# Altium schematic sheet Opamp_Sheet-v4.0.3.SchDoc
size 420 x 297 mm; SheetNumber: 1; SheetTotal: 1
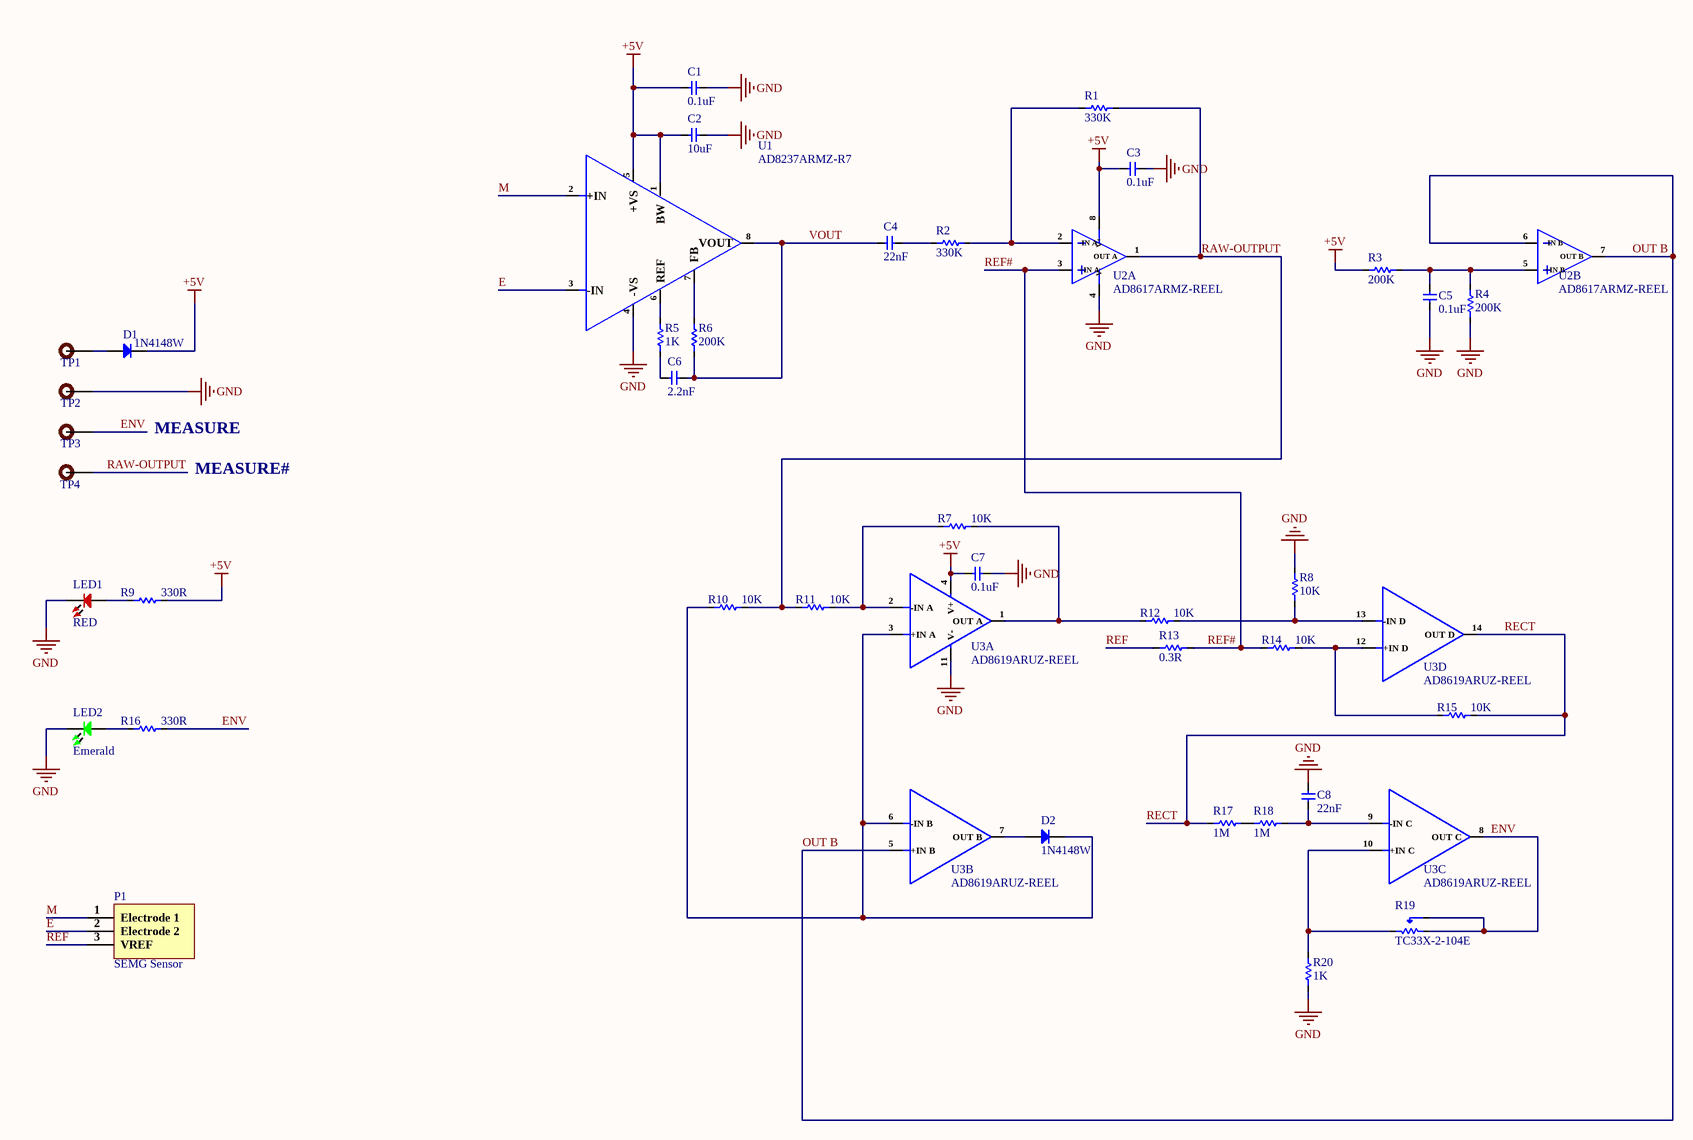
[diagram p0: Opamp_Sheet-v4.0.3.SchDoc]

## Parts
C1  0.1uF  [Cap-0402]
C2  10uF  [Cap-0603]
C3  0.1uF  [Cap-0402]
C4  22nF  [Cap-0402]
C5  0.1uF  [Cap-0402]
C6  2.2nF  [Cap-0402]
C7  0.1uF  [Cap-0402]
C8  22nF  [Cap-0402]
D1  1N4148W  [SOD-123]
D2  1N4148W  [SOD-123]
LED1  RED  [LED-0603]
LED2  Emerald  [LED-0603]
P1  SEMG Sensor  [sEMG-sensor]
R1  330K  [Res-0402]
R2  330K  [Res-0402]
R3  200K  [Res-0402]
R4  200K  [Res-0402]
R5  1K  [Res-0402]
R6  200K  [Res-0402]
R7  10K  [Res-0402]
R8  10K  [Res-0402]
R9  330R  [Res-0402]
R10  10K  [Res-0402]
R11  10K  [Res-0402]
R12  10K  [Res-0402]
R13  0.3R  [Res-0603]
R14  10K  [Res-0402]
R15  10K  [Res-0402]
R16  330R  [Res-0402]
R17  1M  [Res-0402]
R18  1M  [Res-0402]
R19  TC33X-2-104E  [TC33X-2-104E_]
R20  1K  [Res-0402]
TP1  TEST POINT  [Test-point]  (value not drawn)  (no BOM)
TP2  TEST POINT  [Test-point]  (value not drawn)  (no BOM)
TP3  TEST POINT  [Test-point]  (value not drawn)  (no BOM)
TP4  TEST POINT  [Test-point]  (value not drawn)  (no BOM)
U1  AD8237ARMZ-R7  [MSOP-8]
U2  AD8617ARMZ-REEL  [MSOP-8]  (parts A,B of 2)
U3  AD8619ARUZ-REEL  [14-TSSOP]  (parts A,B,C,D of 4)

## Nets
+5V: C1.1 C2.1 C3.1 C7.1 D1.2(K) R3.2 R9.1 U1.1(BW) U1.5(+VS) U2.8(V+) U3.4(V+)
GND: C1.2 C2.2 C3.2 C5.1 C7.2 C8.2 LED1.2 LED2.2 R4.1 R8.2 R20.1 TP2.1 U1.4(-VS) U2.4(V-) U3.11(V-)
E: P1.2(Electrode_2) U1.3(-IN)
ENV: R16.1 R19.1(CCW) R19.2(Wiper) TP3.1 U3.8(OUT_C)
M: P1.1(Electrode_1) U1.2(+IN)
OUT B: U2.6(-IN_B) U2.7(OUT_B) U3.5(+IN_B)
RAW-OUTPUT: R1.2 R10.2 R11.1 TP4.1 U2.1(OUT_A)
RECT: R15.2 R17.1 U3.14(OUT_D)
REF: P1.3(VREF) R13.1
REF#: R13.2 R14.1 U2.3(+IN_A)
VOUT: C4.1 C6.1 R6.2 U1.8(VOUT)
NetC4_2: C4.2 R2.1
NetC5_2: C5.2 R3.1 R4.2 U2.5(+IN_B)
NetC6_2: C6.2 R5.2
NetC8_1: C8.1 R18.2 U3.9(-IN_C)
NetD1_1: D1.1(A) TP1.1
NetD2_1: D2.1(A) U3.7(OUT_B)
NetD2_2: D2.2(K) R10.1 U3.3(+IN_A) U3.6(-IN_B)
NetLED1_1: LED1.1 R9.2
NetLED2_1: LED2.1 R16.2
NetR1_1: R1.1 R2.2 U2.2(-IN_A)
NetR5_1: R5.1 U1.6(REF)
NetR6_1: R6.1 U1.7(FB)
NetR7_1: R7.1 R11.2 U3.2(-IN_A)
NetR7_2: R7.2 R12.1 U3.1(OUT_A)
NetR8_1: R8.1 R12.2 U3.13(-IN_D)
NetR14_2: R14.2 R15.1 U3.12(+IN_D)
NetR17_2: R17.2 R18.1
NetR19_3: R19.3(CW) R20.2 U3.10(+IN_C)

## Notes on the sheet
- MEASURE
- MEASURE#
- File:
- Title:
- Date:
- Page
- Num:
- Total:
- Drawn By: Huzaifa Ali

## Library data of the parts
C1 C3 C5 C7 = C1005X5R1H104K050BB: CAP CER 0.1UF 50V X5R 0402; Manufacturer: TDK; Dielectric Material: Ceramic; Capacitance: 100nF; Tolerance: 10%; Item Type: Capacitor; Supplier 1: Digi-Key; Manufacturer Part Number: C1005X5R1H104K050BB; Stock 1: 1455182; Pricing 1: 1=0.12, 10=0.09, 50=0.049, 100=0.04, 500=0.02858, 1000=0.02245, 2500=0.02041, 5000=0.01878 (USD); Mount: Surface Mount; Case/Package: 0402; Case Code (Metric): 1005; Case Code (Imperial): 0402; Weight: 2.3E-05oz; Min Operating Temperature: -55°C; Max Operating Temperature: 85°C; Dielectric: X5R; Voltage Rating: 50V; Packaging: Tape and Reel; Voltage Rating (DC): 50V; Termination: SMD/SMT; Construction: Flat; Package Quantity: 1; Resistor Type: Ceramic; Voltage: 50V; Series: C; Length: 1mm; Width: 0.02inch; Height: 0.5mm; Depth: 0.5mm; Thickness: 0.022inch; Radiation Hardening: No; Lead Free: Lead Free; REACH SVHC: No SVHC; RoHS Compliant: Yes; ComponentLink1URL: https://product.tdk.com/info/en/catalog/spec/mlccspec_commercial_general_midvoltage_en.pdf?src-supplier=Digi-Key; ComponentLink1Description: https://product.tdk.com/info/en/catalog/spec/mlccspec_commercial_general_midvoltage_en.pdf?src-supplier=Digi-Key; ComponentLink2URL: http://www.tdk.co.jp/tefe02/e413_c.pdf?src-supplier=Future+Electronics; ComponentLink2Description: http://www.tdk.co.jp/tefe02/e413_c.pdf?src-supplier=Future+Electronics; ComponentLink3URL: https://www.verical.com/server-webapp/html/getDatasheet?partID=743571&src-supplier=Verical; ComponentLink3Description: https://www.verical.com/server-webapp/html/getDatasheet?partID=743571&src-supplier=Verical; ComponentLink4URL: http://www.tdk.co.jp/tefe02/e412_c.pdf?src-supplier=Avnet+Europe; ComponentLink4Description: http://www.tdk.co.jp/tefe02/e412_c.pdf?src-supplier=Avnet+Europe; Supplier Part Number 1: 445-5942-1-ND; LCSC Part Number: C2181865
C2 = GRM188R6YA106MA73D: 10uF 35V X5R 20% Pad SMD 0603; Manufacturer: Murata; Supplier 1: Arrow Electronics; Manufacturer Part Number: GRM188R6YA106MA73D; RoHS: Yes; Category: Ceramic Capacitors; Stock 1: 37601; Pricing 1: 1=0.36650, 10=0.23380, 25=0.23160, 100=0.15050, 250=0.14890, 500=0.10700, 1000=0.09270, 3000=0.08640, 6000=0.07720, 15000=0.07140, 30000=0.05840 (USD); Mount: Surface Mount; Case/Package: 0603; Case Code (Metric): 1608; Case Code (Imperial): 0603; Min Operating Temperature: -55°C; Max Operating Temperature: 85°C; Packaging: Tape and Reel; Capacitance: 10uF; Voltage Rating: 35V; Tolerance: 20%; Voltage Rating (DC): 35V; Dielectric: X5R; Length: 0.063inch; Width: 0.031inch; Thickness: 0.039inch; RoHS Compliant: Yes; ComponentLink1URL: http://search.murata.co.jp/Ceramy/image/img/A01X/G101/ENG/GRM188R6YA106MA73-01.pdf?src-supplier=Future+Electronics; ComponentLink1Description: http://search.murata.co.jp/Ceramy/image/img/A01X/G101/ENG/GRM188R6YA106MA73-01.pdf?src-supplier=Future+Electronics; ComponentLink2URL: http://search.murata.co.jp/Ceramy/image/img/A01X/G101/ENG/GRM188R6YA106MA73-01.pdf?src-supplier=Digi-Key; ComponentLink2Description: http://search.murata.co.jp/Ceramy/image/img/A01X/G101/ENG/GRM188R6YA106MA73-01.pdf?src-supplier=Digi-Key; ComponentLink3URL: https://www.murata.com/~/media/webrenewal/support/library/catalog/products/capacitor/mlcc/c02e.ashx?la=en-us&src-supplier=Digi-Key; ComponentLink3Description: https://www.murata.com/~/media/webrenewal/support/library/catalog/products/capacitor/mlcc/c02e.ashx?la=en-us&src-supplier=Digi-Key; ComponentLink4URL: http://search.murata.co.jp/Ceramy/image/img/A01X/G101/ENG/GRM188R6YA106MA73-01.pdf?src-supplier=Mouser; ComponentLink4Description: http://search.murata.co.jp/Ceramy/image/img/A01X/G101/ENG/GRM188R6YA106MA73-01.pdf?src-supplier=Mouser; ComponentLink5URL: http://search.murata.co.jp/Ceramy/image/img/A01X/G101/ENG/GRM188R6YA106MA73-01.pdf?src-supplier=TTI; ComponentLink5Description: http://search.murata.co.jp/Ceramy/image/img/A01X/G101/ENG/GRM188R6YA106MA73-01.pdf?src-supplier=TTI; Supplier Part Number 1: GRM188R6YA106MA73D; LCSC Part Number: C194427
C4 = CC0402KRX5R7BB223: CAP CER 0.022UF 16V X5R 0402; Manufacturer: Yageo; Tolerance: 10%; Supplier 1: Mouser; Manufacturer Part Number: CC0402KRX5R7BB223; RoHS: Yes; Category: Ceramic Capacitors; Stock 1: 31160; Pricing 1: 1=0.10000, 10=0.05600, 50=0.05600, 100=0.02500, 1000=0.01400, 10000=0.01000 (USD); Mount: Surface Mount; Case/Package: 0402; Case Code (Metric): 1005; Case Code (Imperial): 0402; Min Operating Temperature: -55°C; Max Operating Temperature: 85°C; Packaging: Tape and Reel; Capacitance: 22nF; Voltage Rating: 16V; Voltage Rating (DC): 16V; Dielectric: X5R; Length: 0.039inch; Width: 0.02inch; Thickness: 0.022inch; Lead Free: Lead Free; Halogen Free: Halogen Free; RoHS Compliant: Yes; ComponentLink1URL: http://www.yageo.com/exep/pages/download/literatures/ProductSelectionGuide%202014_Final_2.pdf?src-supplier=Digi-Key; ComponentLink1Description: http://www.yageo.com/exep/pages/download/literatures/ProductSelectionGuide%202014_Final_2.pdf?src-supplier=Digi-Key; ComponentLink2URL: http://www.yageo.com/documents/recent/UPY-GPHC_X5R_4V-to-50V_25.pdf?src-supplier=Digi-Key; ComponentLink2Description: http://www.yageo.com/documents/recent/UPY-GPHC_X5R_4V-to-50V_25.pdf?src-supplier=Digi-Key; Supplier Part Number 1: 603-CC402KRX5R7BB223; LCSC Part Number: C541399
C6 = 04025C222JAT2A: CAP CER 2.2nF 50V X7R ±5% 0402 MLCC - SMD/SMT ROHS; Manufacturer: Kyocera AVX; Item Type: Capacitor; Manufacturer Part Number: 04025C222JAT2A; Package: 0402; LCSC Part Number: C597041; ComponentLink1Description: LCSC; ComponentLink1URL: https://www.lcsc.com/product-detail/Multilayer-Ceramic-Capacitors-MLCC-SMD-SMT_Kyocera-AVX-04025C222JAT2A_C597041.html
C8 = CC0402JRX7R7BB223: CAP CER 0.022UF 16V X7R 0402; Manufacturer: Yageo; Tolerance: 5%; Item Type: Capacitor; Supplier: Digikey; Supplier Part Number: 311-3758-1-ND; Manufacturer Part Number: CC0402JRX7R7BB223; RoHS: Yes; Category: Ceramic Capacitors; Stock: 4203; Pricing: 1=0.1, 10=0.033, 50=0.0192, 100=0.0149, 500=0.0112, 1000=0.0088, 2500=0.008, 5000=0.00736 (USD); Mounting Technology: Surface Mount; Case/Package: 0402; Case Code (Imperial): 0402; Case Code (Metric): 1005; Weight: 2.3E-05oz; Min Operating Temperature: -55°C; Max Operating Temperature: 125°C; Value: 22nF; Packaging: Tape and Reel; Voltage Rating: 16V; Voltage Rating (DC): 16V; Dielectric: X7R; Termination: SMD/SMT; Series: CC; Length: 0.039inch; Width: 0.5mm; Thickness: 0.022inch; RoHS Compliant: Yes; Halogen Free: 5694HalogenFree; Lead Free: 5697LeadFree; ComponentLink1URL: https://datasheet.ciiva.com/13264/upy-gphc-x7r-6-3v-to-50v-8-12304-13264039.pdf?src-supplier=Mouser; ComponentLink1Description: https://datasheet.ciiva.com/13264/upy-gphc-x7r-6-3v-to-50v-8-12304-13264039.pdf?src-supplier=Mouser; LCSC Part Number: C541459
D1 D2 = 1N4148W: 100V 400mW Single 1.25V@150mA 8ns 300mA SOD-123 Switching Diode ROHS; Manufacturer: JSMSEMI; ComponentLink1Description: LCSC; ComponentLink1URL: https://www.lcsc.com/product-detail/Switching-Diode_JSMSEMI-1N4148W_C917030.html; Manufacturer Part Number: 1N4148W; Package: SOD-123; LCSC Part Number: C917030; Item Type: Diode
LED1 = NCD0603R3: RED LED 0603 Light Emitting Diodes; Manufacturer: Foshan NationStar Optoelectronics; Manufacturer Part Number: NCD0603R3; Package: 0603; Item Type: LED; LCSC Part Number: C3151730; ComponentLink1Description: LCSC; ComponentLink1URL: https://www.lcsc.com/product-detail/Light-Emitting-Diodes-LED_Foshan-NationStar-Optoelectronics-NCD0603R3_C3151730.html
LED2 = NCD0603G2: Emerald 0603 Light Emitting Diodes (LED) ROHS; Manufacturer: Foshan NationStar Optoelectronics; Manufacturer Part Number: NCD0603G2; Package: 0603; LCSC Part Number: C87326; Item Type: LED; ComponentLink1Description: LCSC; ComponentLink1URL: https://www.lcsc.com/product-detail/Light-Emitting-Diodes-LED_Foshan-NationStar-Optoelectronics-NCD0603G2_C87326.html
P1 = SEMG Sensor: Sensor Connecting Pads
R1 R2 = CRCW0402330KFKEDC: RES 330K OHM 1% 1/16W 0402; Manufacturer: Vishay; Power Rating: 63mW; Value: 330kR; Item Type: Resistor; Supplier: Mouser; Supplier Part Number: 71-CRCW0402330KFKEDC; Manufacturer Part Number: CRCW0402330KFKEDC; RoHS: Yes; Category: Chip SMD Resistors; Stock: 34154; Pricing: 1=0.1, 10=0.017, 50=0.017, 100=0.008, 1000=0.005, 10000=0.004 (USD); Case/Package: 0402; Tolerance: 1%; Lead Free: Lead Free; RoHS Compliant: Yes; LCSC Part Number: C3009051
R3 R4 R6 = RC0402DR-07200KL: RES 200K OHM 0.5% 1/16W 0402; Manufacturer: Yageo; Resistance: 200kR; Max Power Dissipation: 63mW; Temperature Coefficient: 100ppm/°C; Supplier 1: Mouser; Manufacturer Part Number: RC0402DR-07200KL; RoHS: Yes; Category: Chip SMD Resistors; Pricing 1: 1=0.13000, 10=0.07000, 50=0.07000, 100=0.02900, 1000=0.01300, 10000=0.00700 (USD); Case/Package: 0402; Min Operating Temperature: -55°C; Max Operating Temperature: 155°C; Packaging: Tape and Reel; Resistor Type: Thick Film; Number of Terminations: 2; Tolerance: 0.5%; Features: Moisture Resistant; Length: 0.039inch; Width: 0.02inch; Height: 0.016inch; ComponentLink1URL: http://www.yageo.com.tw/exep/pages/download/literatures/PYu-R_INT-thick_7.pdf?src-supplier=Digi-Key; ComponentLink1Description: http://www.yageo.com.tw/exep/pages/download/literatures/PYu-R_INT-thick_7.pdf?src-supplier=Digi-Key; Supplier Part Number 1: 603-RC0402DR-07200KL; LCSC Part Number: C138077
R5 R20 = RC0402FR-071KL: RES 1K OHM 1% 1/16W 0402; Manufacturer: Yageo; Resistance: 1kR; Temperature Coefficient: 100ppm/°C; Voltage Rating (DC): 50V; Power Rating: 62.5mW; Max Power Dissipation: 63mW; Item Type: Resistor; Supplier 1: Avnet; Manufacturer Part Number: RC0402FR-071KL; RoHS: Yes; Category: Chip SMD Resistors; Stock 1: 13030000; Pricing 1: 10000=0.00085, 20000=0.00087, 40000=0.00084, 60000=0.00083, 80000=0.00079, 100000=0.00078, 1000000=0.00076 (USD); Case/Package: 0402; Number of Pins: 2; Case Code (Imperial): 0402; Case Code (Metric): 1005; Size Code: 0402; Min Operating Temperature: -55°C; Max Operating Temperature: 155°C; Resistor Type: Thick Film; Tolerance: 1%; Packaging: Tape and Reel; Voltage Rating: 50V; Termination: SMD/SMT; Features: Moisture Resistant; Series: RC; Number of Terminations: 2; Resistance Tolerance: 1%; Construction: Rectangular; Technology: THICK FILM; Length: 1mm; Width: 0.5mm; Height: 0.32mm; Depth: 0.5mm; Reach SVHC Compliant: Yes; Lead Free: Lead Free; RoHS Compliant: Yes; Military Standard: Not; ComponentLink1URL: https://datasheet.ciiva.com/11819/0900766b80c66297-11819477.pdf?src-supplier=RSComponents; ComponentLink1Description: https://datasheet.ciiva.com/11819/0900766b80c66297-11819477.pdf?src-supplier=RSComponents; ComponentLink2URL: https://datasheet.ciiva.com/7983/1018594-7983502.pdf?src-supplier=Element14; ComponentLink2Description: https://datasheet.ciiva.com/7983/1018594-7983502.pdf?src-supplier=Element14; ComponentLink3URL: https://datasheet.ciiva.com/22747/1018594-22747513.pdf?src-supplier=Element14; ComponentLink3Description: https://datasheet.ciiva.com/22747/1018594-22747513.pdf?src-supplier=Element14; ComponentLink4URL: https://datasheet.ciiva.com/12666/pyu-rc0402-51-rohs-l-6-r-12666741.pdf?src-supplier=Mouser; ComponentLink4Description: https://datasheet.ciiva.com/12666/pyu-rc0402-51-rohs-l-6-r-12666741.pdf?src-supplier=Mouser; ComponentLink5URL: https://datasheet.ciiva.com/7849/1018594-7849869.pdf?src-supplier=Element14; ComponentLink5Description: https://datasheet.ciiva.com/7849/1018594-7849869.pdf?src-supplier=Element14; ComponentLink6URL: https://datasheet.ciiva.com/7849/1018594-7849871.pdf?src-supplier=Element14; ComponentLink6Description: https://datasheet.ciiva.com/7849/1018594-7849871.pdf?src-supplier=Element14; ComponentLink7URL: https://datasheet.ciiva.com/17063/pyu-rc0402-51-rohs-l-6-r-17063193.pdf?src-supplier=Future+Electronics; ComponentLink7Description: https://datasheet.ciiva.com/17063/pyu-rc0402-51-rohs-l-6-r-17063193.pdf?src-supplier=Future+Electronics; Supplier Part Number 1: RC0402FR-071KL; LCSC Part Number: C106235
R7 R8 R10-R12 R14 R15 = RC0402FR-0710KL: RES 10K OHM 1% 1/16W 0402; Manufacturer: Yageo; Resistance: 10kR; Voltage Rating (DC): 50V; Temperature Coefficient: 100ppm/°C; Power Rating: 62.5mW; Max Power Dissipation: 63mW; Item Type: Resistor; Supplier 1: Mouser; Manufacturer Part Number: RC0402FR-0710KL; RoHS: Yes; Category: Chip SMD Resistors; Stock 1: 18648329; Pricing 1: 1=0.10000, 10=0.01400, 50=0.01400, 100=0.00500, 1000=0.00300, 10000=0.00200 (USD); Case/Package: 0402; Number of Pins: 2; Case Code (Imperial): 0402; Case Code (Metric): 1005; Min Operating Temperature: -55°C; Max Operating Temperature: 155°C; Resistor Type: Thick Film; Tolerance: 1%; Packaging: Tape and Reel; Voltage Rating: 50V; Termination: SMD/SMT; Working Voltage: 50V; Number of Terminations: 2; Features: Moisture Resistant; Series: RC; Resistance Tolerance: 1%; Construction: Rectangular; Length: 1mm; Width: 0.5mm; Height: 0.32mm; Depth: 0.5mm; Lead Pitch: 0.2mm; REACH SVHC: No SVHC; Lead Free: Lead Free; RoHS Compliant: Yes; Military Standard: Not; ComponentLink1URL: https://datasheet.ciiva.com/7660/38568-7660787.pdf?src-supplier=Element14; ComponentLink1Description: https://datasheet.ciiva.com/7660/38568-7660787.pdf?src-supplier=Element14; ComponentLink2URL: https://datasheet.ciiva.com/7849/1686128-7849814.pdf?src-supplier=Element14; ComponentLink2Description: https://datasheet.ciiva.com/7849/1686128-7849814.pdf?src-supplier=Element14; ComponentLink3URL: https://datasheet.ciiva.com/7983/1018594-7983486.pdf?src-supplier=Element14; ComponentLink3Description: https://datasheet.ciiva.com/7983/1018594-7983486.pdf?src-supplier=Element14; ComponentLink4URL: https://datasheet.ciiva.com/22747/1018594-22747512.pdf?src-supplier=Element14; ComponentLink4Description: https://datasheet.ciiva.com/22747/1018594-22747512.pdf?src-supplier=Element14; ComponentLink5URL: https://datasheet.ciiva.com/12667/pyu-rc0402-51-rohs-l-6-r-12667067.pdf?src-supplier=Mouser; ComponentLink5Description: https://datasheet.ciiva.com/12667/pyu-rc0402-51-rohs-l-6-r-12667067.pdf?src-supplier=Mouser; ComponentLink6URL: https://datasheet.ciiva.com/7849/1784430-7849813.pdf?src-supplier=Element14; ComponentLink6Description: https://datasheet.ciiva.com/7849/1784430-7849813.pdf?src-supplier=Element14; ComponentLink7URL: https://datasheet.ciiva.com/7849/1784430-7849815.pdf?src-supplier=Element14; ComponentLink7Description: https://datasheet.ciiva.com/7849/1784430-7849815.pdf?src-supplier=Element14; Supplier Part Number 1: 603-RC0402FR-0710KL; LCSC Part Number: C60490
R9 R16 = RC0402FR-070RL: RES 0 OHM JUMPER 1/16W 0402; Manufacturer: Yageo; Item Type: Resistors; Resistance: 0R; Tolerance: 1%; Power Rating: 62.5mW; Voltage Rating: 50V; Temperature Coefficient: 200ppm/°C; Max Power Dissipation: 63mW; Supplier 1: Mouser; Manufacturer Part Number: RC0402FR-070RL; RoHS: Yes; Stock 1: 8556842; Pricing 1: 1=0.10000, 10=0.01400, 50=0.01400, 100=0.00600, 1000=0.00300, 5000=0.00200, 10000=0.00100 (USD); Mount: Surface Mount; Case/Package: 0402; Contact Plating: Tin,Matte; Case Code (Imperial): 0402; Case Code (Metric): 1005; Size Code: 0402; Min Operating Temperature: -55°C; Max Operating Temperature: 155°C; Resistor Type: Thick Film; Packaging: Tape and Reel; Termination: SMD/SMT; Features: Moisture Resistant; Series: RC; Number of Terminations: 2; Length: 1mm; Width: 0.5mm; Height: 0.35mm; Radiation Hardening: No; Lead Free: Lead Free; RoHS Compliant: Yes; ComponentLink1URL: https://datasheet.ciiva.com/8896/pyu-rc0402-51-rohs-l-6-8896149.pdf?src-supplier=Avnet; ComponentLink1Description: https://datasheet.ciiva.com/8896/pyu-rc0402-51-rohs-l-6-8896149.pdf?src-supplier=Avnet; ComponentLink2URL: https://datasheet.ciiva.com/16790/pyu-rc0402-51-rohs-l-6-r-16790444.pdf?src-supplier=Future+Electronics; ComponentLink2Description: https://datasheet.ciiva.com/16790/pyu-rc0402-51-rohs-l-6-r-16790444.pdf?src-supplier=Future+Electronics; Supplier Part Number 1: 603-RC0402FR-070RL; LCSC Part Number: C106231
R13 = RL0603FR-070R3L: RES 0.3 OHM 1% 1/10W 0603; Manufacturer: Yageo; Item Type: Resistor; Value: 300mR; Max Power Dissipation: 100mW; Temperature Coefficient: 800ppm/°C; Supplier: Digikey; Supplier Part Number: 13-RL0603FR-070R3LCT-ND; Manufacturer Part Number: RL0603FR-070R3L; RoHS: Yes; Stock: 13643; Pricing: 1=0.24, 10=0.125, 50=0.0854, 100=0.0736, 500=0.054, 1000=0.04784 (USD); Case/Package: 0603; Min Operating Temperature: -55°C; Max Operating Temperature: 155°C; Packaging: Tape and Reel; Number of Terminations: 2; Tolerance: 1%; Features: Moisture Resistant; Series: RL; Length: 0.063inch; Width: 0.031inch; Height: 0.022inch; RoHS Compliant: Yes; ComponentLink1URL: http://www.mouser.com/ds/2/447/PYu-RL_521_RoHS_L_5-2927.pdf?src-supplier=Mouser; ComponentLink1Description: http://www.mouser.com/ds/2/447/PYu-RL_521_RoHS_L_5-2927.pdf?src-supplier=Mouser; ComponentLink2URL: http://www.yageo.com/documents/recent/PYu-RL_Group_521_RoHS_L_2.pdf?src-supplier=Digikey; ComponentLink2Description: http://www.yageo.com/documents/recent/PYu-RL_Group_521_RoHS_L_2.pdf?src-supplier=Digikey
R17 R18 = RC0402FR-071ML: RES 1M OHM 1% 1/16W 0402; Manufacturer: Yageo; Value: 1MR; Power Rating: 63mW; Voltage Rating: 50V; Temperature Coefficient: 100ppm/°C; Item Type: Resistor; Supplier: Digikey; Supplier Part Number: 311-1.00MLRCT-ND; Manufacturer Part Number: RC0402FR-071ML; RoHS: Yes; Category: Chip SMD Resistors; Stock: 6516; Pricing: 1=0.1, 10=0.015, 50=0.0088, 100=0.0073, 500=0.00488, 1000=0.00417, 5000=0.00297 (USD); Case/Package: 0402; Case Code (Imperial): 0402; Case Code (Metric): 1005; Min Operating Temperature: -55°C; Max Operating Temperature: 155°C; Resistor Type: Thick Film; Packaging: Tape and Reel; Tolerance: 1%; Termination: SMD/SMT; Features: Moisture Resistant; Series: RC; Max Power Dissipation: 63mW; Number of Terminations: 2; Resistance Tolerance: 1%; Construction: Rectangular; Technology: THICK FILM; Voltage Rating (AC): 50V; Length: 1mm; Height: 0.32mm; Depth: 0.5mm; RoHS Compliant: Yes; Military Standard: Not; Reach SVHC Compliant: Unknown; Lead Free: 5697LeadFree; ComponentLink1URL: https://datasheet.ciiva.com/11808/0900766b80c66297-11808125.pdf?src-supplier=Rs; ComponentLink1Description: https://datasheet.ciiva.com/11808/0900766b80c66297-11808125.pdf?src-supplier=Rs; ComponentLink2URL: https://datasheet.ciiva.com/46394/1018594-46394951.pdf?src-supplier=Element14; ComponentLink2Description: https://datasheet.ciiva.com/46394/1018594-46394951.pdf?src-supplier=Element14; ComponentLink3URL: https://datasheet.ciiva.com/7849/1018594-7849883.pdf?src-supplier=Element14; ComponentLink3Description: https://datasheet.ciiva.com/7849/1018594-7849883.pdf?src-supplier=Element14; ComponentLink4URL: https://datasheet.ciiva.com/7849/1018594-7849882.pdf?src-supplier=Element14; ComponentLink4Description: https://datasheet.ciiva.com/7849/1018594-7849882.pdf?src-supplier=Element14; ComponentLink5URL: https://datasheet.ciiva.com/16741/pyu-rc0402-51-rohs-l-6-r-16741081.pdf?src-supplier=Future+Electronics; ComponentLink5Description: https://datasheet.ciiva.com/16741/pyu-rc0402-51-rohs-l-6-r-16741081.pdf?src-supplier=Future+Electronics; LCSC Part Number: C138033
R19 = TC33X-2-104E: TRIMMER 100K OHM 0.1W J LEAD TOP; Manufacturer: Bourns; Resistance: 100kR; Tolerance: 25%; Power Rating: 100mW; Number of Turns: 1; Temperature Coefficient: 250ppm/°C; Voltage Rating (DC): 50V; Item Type: Potentiometer; Supplier 1: Arrow Electronics; Manufacturer Part Number: TC33X-2-104E; RoHS: Yes; Category: Variable Resistors and Potentiometers; Stock 1: 12500; Pricing 1: 2500=0.15500, 5000=0.13130 (USD); Mount: Surface Mount; Color: Silver; Weight: 29.4mg; Min Operating Temperature: -40°C; Max Operating Temperature: 100°C; Packaging: Tape and Reel; Package Quantity: 2500; Resistor Type: Carbon,Cermet; Termination: Foot Print; Max Power Dissipation: 100mW; Series: TC33; Resistance Tolerance: 25%; Length: 3mm; Width: 0.118inch; Height: 0.047inch; Depth: 3.8mm; Radiation Hardening: No; REACH SVHC: No SVHC; Military Standard: Not; RoHS Compliant: Yes; ComponentLink1URL: https://datasheet.ciiva.com/11832/0900766b802749b3-11832506.pdf?src-supplier=RSComponents; ComponentLink1Description: https://datasheet.ciiva.com/11832/0900766b802749b3-11832506.pdf?src-supplier=RSComponents; ComponentLink2URL: https://datasheet.ciiva.com/8700/tc33-8700395.pdf?src-supplier=Avnet; ComponentLink2Description: https://datasheet.ciiva.com/8700/tc33-8700395.pdf?src-supplier=Avnet; ComponentLink3URL: https://datasheet.ciiva.com/2155/tc33-2155965.pdf?src-supplier=Digi-Key; ComponentLink3Description: https://datasheet.ciiva.com/2155/tc33-2155965.pdf?src-supplier=Digi-Key; ComponentLink4URL: https://datasheet.ciiva.com/7953/1818686-7953181.pdf?src-supplier=Element14; ComponentLink4Description: https://datasheet.ciiva.com/7953/1818686-7953181.pdf?src-supplier=Element14; ComponentLink5URL: https://datasheet.ciiva.com/16716/70155234-16716301.pdf?src-supplier=Allied+Electronics; ComponentLink5Description: https://datasheet.ciiva.com/16716/70155234-16716301.pdf?src-supplier=Allied+Electronics; ComponentLink6URL: https://datasheet.ciiva.com/2155/tc33-2155966.pdf?src-supplier=Digi-Key; ComponentLink6Description: https://datasheet.ciiva.com/2155/tc33-2155966.pdf?src-supplier=Digi-Key; ComponentLink7URL: https://datasheet.ciiva.com/7953/1818686-7953182.pdf?src-supplier=Element14; ComponentLink7Description: https://datasheet.ciiva.com/7953/1818686-7953182.pdf?src-supplier=Element14; ComponentLink8URL: https://datasheet.ciiva.com/2155/tc33-2155967.pdf?src-supplier=Digi-Key; ComponentLink8Description: https://datasheet.ciiva.com/2155/tc33-2155967.pdf?src-supplier=Digi-Key; Supplier Part Number 1: TC33X-2-104E; LCSC Part Number: C719186
TP1-TP4 = TEST POINT: Test Point ON; Item Type: TEST POINT
U1 = AD8237ARMZ-R7: IC INST AMP 1 CIRCUIT 8MSOP; Manufacturer: Analog Devices; Supplier: Mouser; LCSC Part Number: C12086; Manufacturer Part Number: AD8237ARMZ-R7; RoHS: Yes; Item Type: IC; Stock: 141226; Pricing: 1=2.88, 10=2.37, 50=2.37, 100=2.13, 1000=1.56, 10000=1.47 (USD); ComponentLink1URL: https://datasheet.ciiva.com/6626/ad8237-6626733.pdf?src-supplier=Digikey; ComponentLink1Description: https://datasheet.ciiva.com/6626/ad8237-6626733.pdf?src-supplier=Digikey; ComponentLink2URL: https://datasheet.ciiva.com/8582/ad8237-8582303.pdf?src-supplier=Avnet; ComponentLink2Description: https://datasheet.ciiva.com/8582/ad8237-8582303.pdf?src-supplier=Avnet
U2 = AD8617ARMZ-REEL: IC CMOS 2 CIRCUIT 8MSOP; Manufacturer: Analog Devices; Supplier: Mouser; LCSC Part Number: C578787; Manufacturer Part Number: AD8617ARMZ-REEL; RoHS: Yes; Item Type: IC; Stock: 4553; Pricing: 1=2.71, 10=2.43, 50=2.43, 100=1.95, 1000=1.33, 10000=1.19 (USD); ComponentLink1URL: https://datasheet.ciiva.com/1793/ad8613-8617-8619-1793776.pdf?src-supplier=Digikey; ComponentLink1Description: https://datasheet.ciiva.com/1793/ad8613-8617-8619-1793776.pdf?src-supplier=Digikey; ComponentLink2URL: https://datasheet.ciiva.com/1793/ad8613-8617-8619-1793777.pdf?src-supplier=Digikey; ComponentLink2Description: https://datasheet.ciiva.com/1793/ad8613-8617-8619-1793777.pdf?src-supplier=Digikey; ComponentLink3URL: https://datasheet.ciiva.com/1793/ad8613-8617-8619-1793778.pdf?src-supplier=Digikey; ComponentLink3Description: https://datasheet.ciiva.com/1793/ad8613-8617-8619-1793778.pdf?src-supplier=Digikey
U3 = AD8619ARUZ-REEL: IC CMOS 4 CIRCUIT 14TSSOP; Manufacturer: Analog Devices; Item Type: Opam; Input Capacitance: 2.5pF; Supplier: Mouser; LCSC Part Number: C653014; Manufacturer Part Number: AD8619ARUZ-REEL; RoHS: Yes; Stock: 2210; Pricing: 1=3.67, 10=3.12, 50=3.12, 100=2.7, 1000=1.94, 10000=1.84 (USD); Lead Free: 5698LeadFree; ComponentLink1URL: http://components.arrow.com/part/dataview/42367262S9299045N2771?src-supplier=Arrow+Electronics; ComponentLink1Description: http://components.arrow.com/part/dataview/42367262S9299045N2771?src-supplier=Arrow+Electronics; ComponentLink2URL: http://www.mouser.com/ds/2/609/AD8613_8617_8619-877840.pdf?src-supplier=Mouser; ComponentLink2Description: http://www.mouser.com/ds/2/609/AD8613_8617_8619-877840.pdf?src-supplier=Mouser; ComponentLink3URL: https://datasheet.octopart.com/AD8619ARUZ-REEL-Analog-Devices-datasheet-62341446.pdf?src-supplier=Element14; ComponentLink3Description: https://datasheet.octopart.com/AD8619ARUZ-REEL-Analog-Devices-datasheet-62341446.pdf?src-supplier=Element14; ComponentLink4URL: http://www.analog.com/static/imported-files/data_sheets/AD8613_8617_8619.pdf?src-supplier=Avnet; ComponentLink4Description: http://www.analog.com/static/imported-files/data_sheets/AD8613_8617_8619.pdf?src-supplier=Avnet; ComponentLink5URL: http://www.analog.com/media/en/technical-documentation/data-sheets/AD8613_8617_8619.pdf?src-supplier=Digikey; ComponentLink5Description: http://www.analog.com/media/en/technical-documentation/data-sheets/AD8613_8617_8619.pdf?src-supplier=Digikey